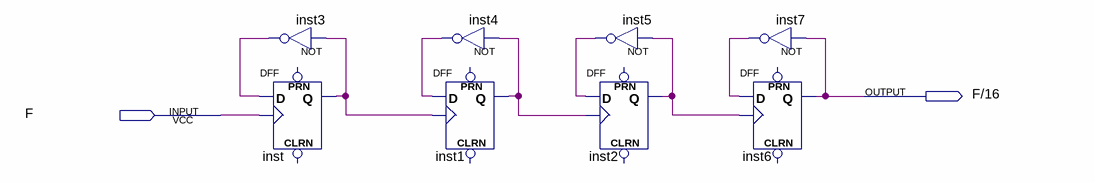
[diagram p0: schematic sheet]
// Quartus schematic Divisor_frequencia.bdf as structural Verilog: 8 symbols, 2 pins
module Divisor_frequencia (
  input  F,
  output \F/16 
);

  wire inst1_q, inst2_q, inst3_out, inst4_out, inst5_out, inst7_out, inst_q;

  not inst3 (inst3_out, inst_q);
  DFF inst (.CLK(F), .D(inst3_out), .Q(inst_q));  // open: CLRN, PRN
  not inst4 (inst4_out, inst1_q);
  DFF inst1 (.CLK(inst_q), .D(inst4_out), .Q(inst1_q));  // open: CLRN, PRN
  not inst5 (inst5_out, inst2_q);
  DFF inst2 (.CLK(inst1_q), .D(inst5_out), .Q(inst2_q));  // open: CLRN, PRN
  not inst7 (inst7_out, \F/16 );
  DFF inst6 (.CLK(inst2_q), .D(inst7_out), .Q(\F/16 ));  // open: CLRN, PRN
endmodule
